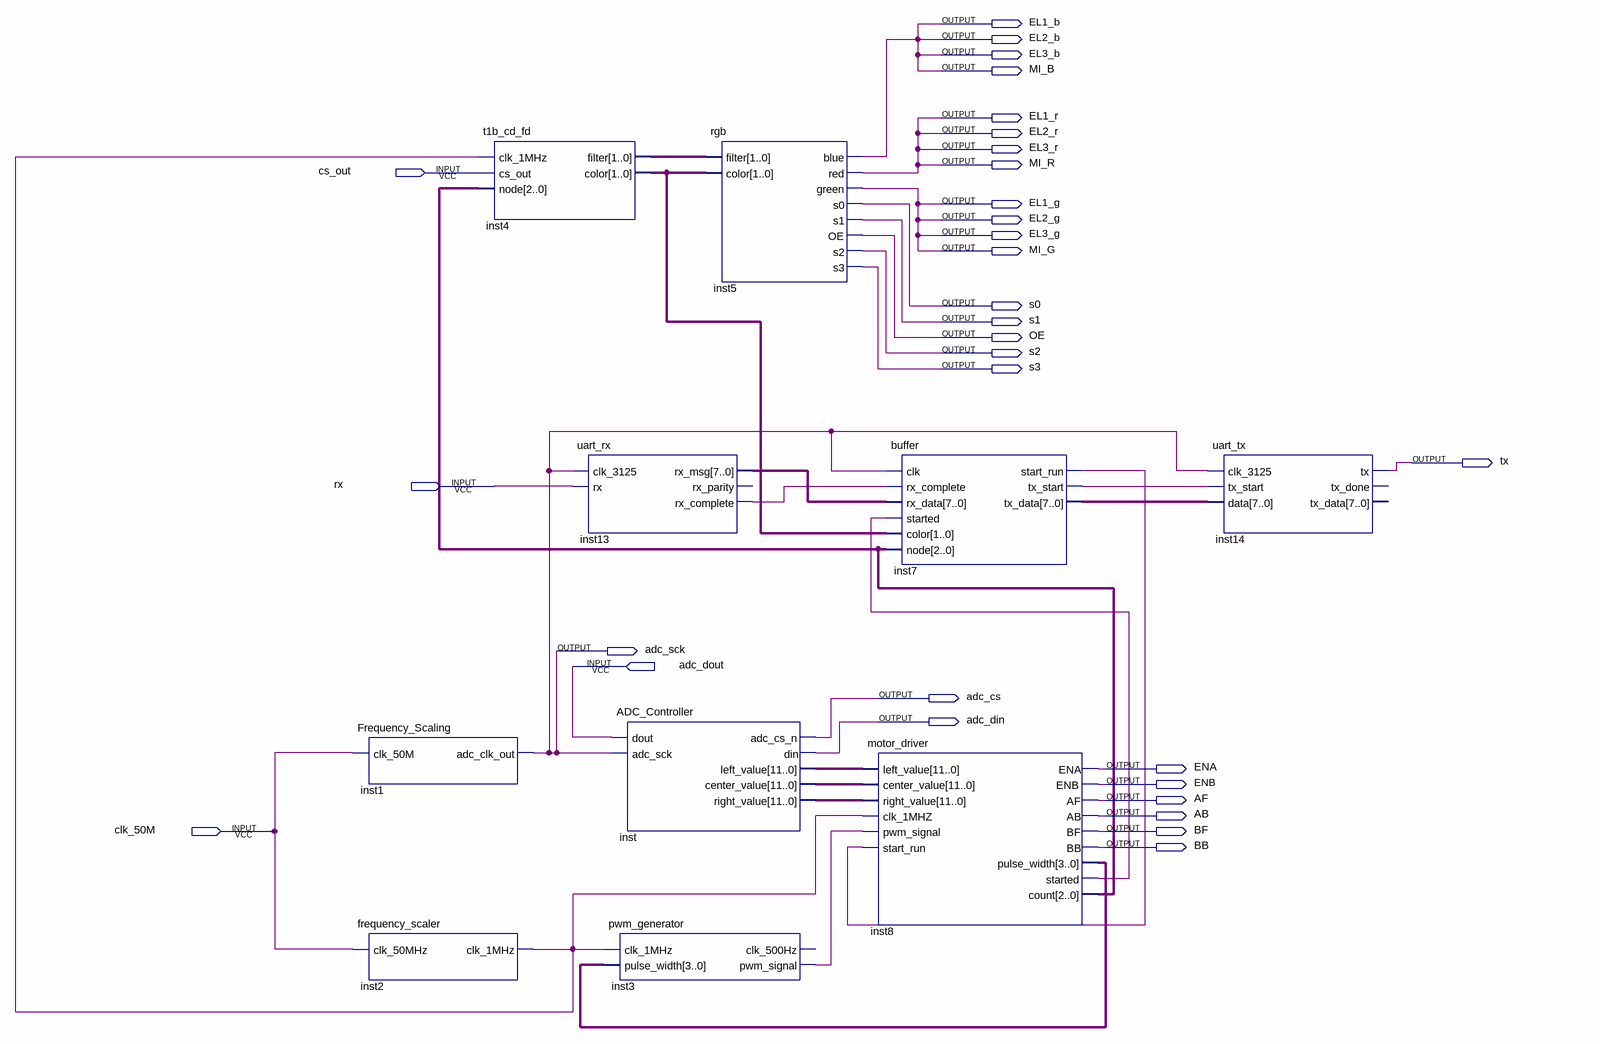
[diagram p0: schematic sheet]
// Quartus schematic LINE_FOLLOWER.bdf as structural Verilog: 10 symbols, 31 pins
module LINE_FOLLOWER (
  input  cs_out,
  input  rx,
  input  adc_dout,
  input  clk_50M,
  output EL1_b,
  output EL2_b,
  output EL3_b,
  output MI_B,
  output EL1_r,
  output EL2_r,
  output EL3_r,
  output MI_R,
  output EL1_g,
  output EL2_g,
  output EL3_g,
  output MI_G,
  output s0,
  output s1,
  output OE,
  output s2,
  output s3,
  output tx,
  output adc_sck,
  output adc_cs,
  output adc_din,
  output ENA,
  output ENB,
  output AF,
  output AB,
  output BF,
  output BB
);

  wire inst2_clk_1mhz, inst3_pwm_signal, inst7_start_run, inst7_tx_start, inst8_started, inst13_rx_complete;
  wire [1:0] inst4_color, inst4_filter;
  wire [2:0] inst8_count;
  wire [3:0] inst8_pulse_width;
  wire [7:0] inst7_tx_data, inst13_rx_msg;
  wire [11:0] inst_center_value, inst_left_value, inst_right_value;

  Frequency_Scaling inst1 (.clk_50M(clk_50M), .adc_clk_out(adc_sck));
  frequency_scaler inst2 (.clk_50MHz(clk_50M), .clk_1MHz(inst2_clk_1mhz));
  t1b_cd_fd inst4 (
    .clk_1MHz(inst2_clk_1mhz), .cs_out(cs_out), .node(inst8_count), .filter(inst4_filter), .color(inst4_color));
  uart_rx inst13 (
    .clk_3125(adc_sck), .rx(rx), .rx_msg(inst13_rx_msg), .rx_complete(inst13_rx_complete));  // open: rx_parity
  ADC_Controller inst (
    .dout(adc_dout), .adc_sck(adc_sck), .adc_cs_n(adc_cs), .din(adc_din), .left_value(inst_left_value),
    .center_value(inst_center_value), .right_value(inst_right_value));
  pwm_generator inst3 (
    .clk_1MHz(inst2_clk_1mhz), .pulse_width(inst8_pulse_width), .pwm_signal(inst3_pwm_signal));  // open: clk_500Hz
  rgb inst5 (
    .filter(inst4_filter), .color(inst4_color), .blue(EL1_b), .red(EL1_r), .green(EL1_g), .s0(s0), .s1(s1),
    .OE(OE), .s2(s2), .s3(s3));
  buffer inst7 (
    .clk(adc_sck), .rx_complete(inst13_rx_complete), .rx_data(inst13_rx_msg), .started(inst8_started),
    .color(inst4_color), .node(inst8_count), .start_run(inst7_start_run), .tx_start(inst7_tx_start),
    .tx_data(inst7_tx_data));
  motor_driver inst8 (
    .left_value(inst_left_value), .center_value(inst_center_value), .right_value(inst_right_value),
    .clk_1MHZ(inst2_clk_1mhz), .pwm_signal(inst3_pwm_signal), .start_run(inst7_start_run), .ENA(ENA),
    .ENB(ENB), .AF(AF), .AB(AB), .BF(BF), .BB(BB), .pulse_width(inst8_pulse_width), .started(inst8_started),
    .count(inst8_count));
  uart_tx inst14 (
    .clk_3125(adc_sck), .tx_start(inst7_tx_start), .data(inst7_tx_data), .tx(tx));  // open: tx_done, tx_data

  assign EL2_b = EL1_b;
  assign EL2_g = EL1_g;
  assign EL2_r = EL1_r;
  assign EL3_b = EL1_b;
  assign EL3_g = EL1_g;
  assign EL3_r = EL1_r;
  assign MI_B = EL1_b;
  assign MI_G = EL1_g;
  assign MI_R = EL1_r;
endmodule
